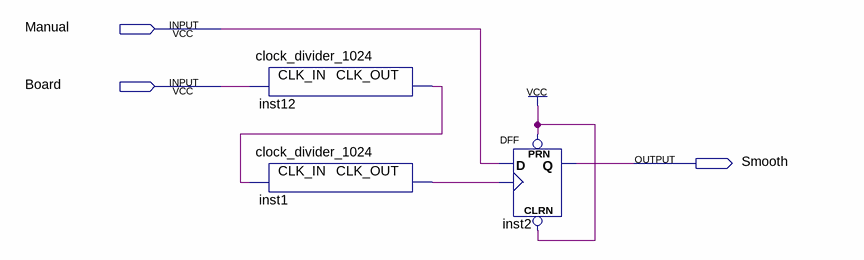
[diagram p0: schematic sheet]
// Quartus schematic Debouncer_Circuit.bdf as structural Verilog: 3 symbols, 3 pins
module Debouncer_Circuit (
  input  Manual,
  input  Board,
  output Smooth
);

  wire inst1_clk_out, inst12_clk_out;

  clock_divider_1024 inst12 (.CLK_IN(Board), .CLK_OUT(inst12_clk_out));
  clock_divider_1024 inst1 (.CLK_IN(inst12_clk_out), .CLK_OUT(inst1_clk_out));
  DFF inst2 (.CLRN(1'b1), .CLK(inst1_clk_out), .D(Manual), .PRN(1'b1), .Q(Smooth));
endmodule
